# Altium schematic sheet Sheet1.SchDoc
size A; SheetNumber: 1; SheetTotal: 1; SPICEModelCacheXZFOUOWA: <root> / <DocumentId>XZFOUOWA</DocumentId> / <CacheFrame Number="0"> / <Model Name="1n4001" Kind="MDL"> / <Text>*1N4001 MCE 8-16-95 / *50V 1A Si GenPurpose Diode pkg:DIODE0.4 1,2 / .MODEL 1N4001 D(IS=2.55E-9 RS=0.042 N=1.75 TT=5.76E-6 CJO=1.85E-11 / + VJ=0.75 M=0.333 BV=50 IBV=1E-5 )</Text> / </Model> / </CacheFrame> / </root>
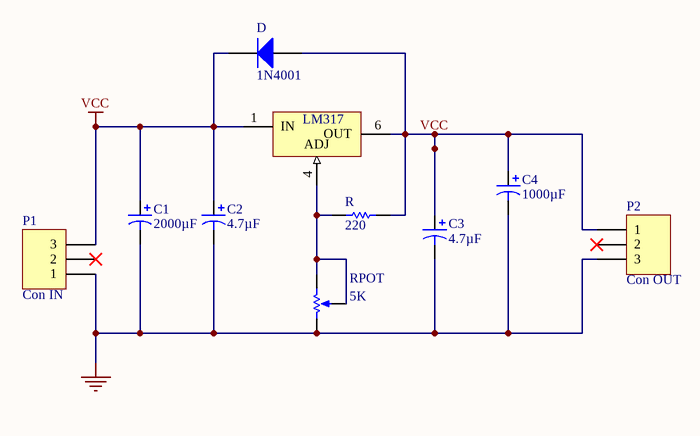
[diagram p0: Sheet1.SchDoc]

## Parts
C1  value 2000µF  [RB7.6-15]  (hidden comment: Cap Pol1)
C2  value 4.7µF  [RB7.6-15]  (hidden comment: Cap Pol1)
C3  value 4.7µF  [RB7.6-15]  (hidden comment: Cap Pol1)
C4  value 1000µF  [RB7.6-15]  (hidden comment: Cap Pol1)
D  1N4001  [DO-41]
NO?  LM317  [PW0008A_M]  (part A of 2)
P1  Con IN  [HDR1X3]
P2  Con OUT  [HDR1X3]
R  value 220  [AXIAL-0.3]  (hidden comment: Res1)
RPOT  value 5K  [VR5]  (hidden comment: RPot)

## Nets
GND: C1.2 C2.2 C3.2 C4.2 P1.1 P2.3 RPOT.2(BOT)
VCC: C1.1 C2.1 C3.1 C4.1 D.1(A) D.2(K) NO?.1(IN) NO?.6(OUT) P1.3 P2.1 R.2
NetNO?_4: NO?.4(ADJ) R.1 RPOT.1(TOP) RPOT.3(TAP)

Not connected (* = marked no-connect by the designer): P1 2*; P2 2*

## Library data of the parts
C1-C4 = Cap Pol1: Polarized Capacitor (Radial); Published: 8-Jun-2000; LatestRevisionDate: 17-Jul-2002; LatestRevisionNote: Re-released for DXP Platform.; PackageReference: RB7.6-15; Publisher: Altium Limited; PackageDescription: Polarized Capacitor (Radial); 2 Leads
D = Diode 1N4001: 1 Amp General Purpose Rectifier; Published: 8-Jun-2000; LatestRevisionDate: 17-Jul-2002; LatestRevisionNote: Re-released for DXP Platform.; DatasheetVersion: 1998; PackageVersion: Aug-1999; PackageReference: DO-41; Publisher: Altium Limited; PackageDescription: Diode, Axial; Body 5.2 x 2.7 mm (LxDia. max), Lead Dia. 0.86 mm (max); Code_JEDEC: DO-204-AL; ComponentLink1Description: Manufacturer Link; ComponentLink1URL: http://www.fairchildsemi.com/; ComponentLink2Description: Datasheet; ComponentLink2URL: http://www.fairchildsemi.com/ds/1N%2F1N4001.pdf
NO? = CMP-0324-00209-3: Adjustable Regulator with 3.7 to 38 V Input and 1.2 to 32 V Output, 0 to 125 degC, 8-Pin TSSOP (PW), Green (RoHS & no Sb/Br); PartNumber: LM317LCPWR; Manufacturer: Texas Instruments; Iout(Max)(A): 0.1; Vin(Min)(V): 3.7; Vin(Max)(V): 38; Vout(Min)(V): 1.2; Vout(Max)(V): 32; DatasheetVersion: SLCS144D; Mounting Technology: Surface Mount; PackageReference: PW0008A; ComponentLink2URL: http://www.ti.com/litv/pdf/mtss001d; Code_JEDEC: MO-153; PackageVersion: revG, Feb-2011; PackageDescription: 8-Pin Plastic Thin Small Outline Package 3 x 4.4 mm Body ,0.65 mm Pitch; Eco-Plan: Green (RoHS & no Sb/Br); ComponentLink2Description: Package Specification; ComponentLink1URL: http://www.ti.com/general/docs/lit/getliterature.tsp?genericPartNumber=LM317L&fileType=pdf; ComponentLink1Description: Datasheet; ComponentLink3URL: Samples URL:http://www.ti.com/product/lm317l#samples; ComponentLink3Description: URL Link1
P1 P2 = Header 3: Header, 3-Pin; LatestRevisionDate: 17-Jul-2002; LatestRevisionNote: Re-released for DXP Platform.; Publisher: Altium Limited
R = Res1: Resistor; Published: 8-Jun-2000; LatestRevisionDate: 17-Jul-2002; LatestRevisionNote: Re-released for DXP Platform.; PackageReference: AXIAL-0.3; Publisher: Altium Limited; PackageDescription: Axial Device, Thru-Hole; 2 Leads; 0.3 in Pin Spacing
RPOT = RPot: Potentiometer; Sim Note: Enter the Resistance value and the set point into parameter fields.; Set Position: 0.5; Published: 8-Jun-2000; LatestRevisionDate: 17-Jul-2002; LatestRevisionNote: Re-released for DXP Platform.; PackageReference: VR5; Publisher: Altium Limited; PackageDescription: Variable Resistor, Thru-Hole; 3 Leads